# Altium project RPI_2354A_v0p0.PrjPcb
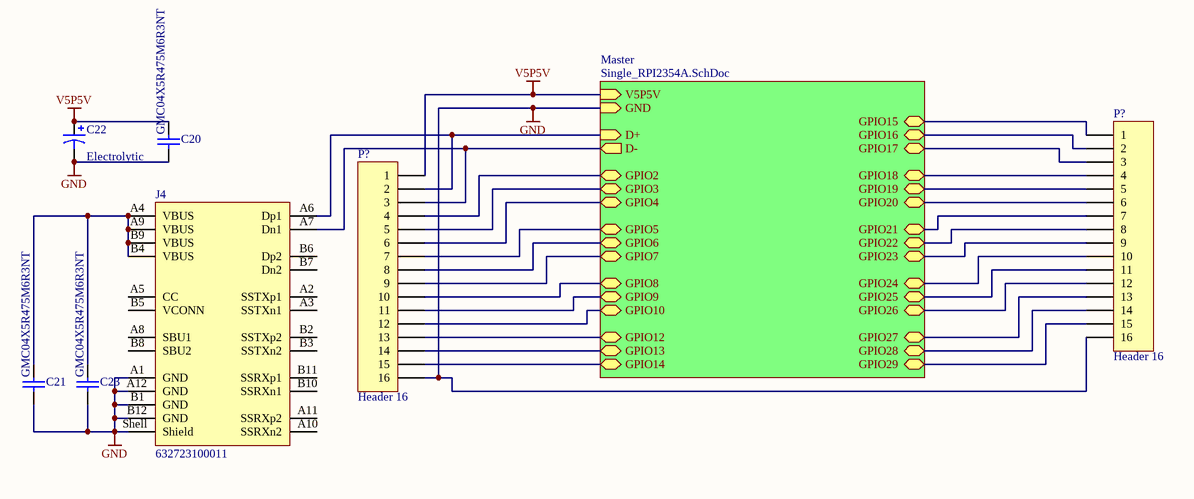
[diagram p0: HUB.SchDoc]
2 sheets, 43 parts. Net scope: hierarchical (ports join the sheet entries above them; power ports are global).
Board file: PCB1.PcbDoc
Sheets:
  HUB.SchDoc
    Master = Single_RPI2354A.SchDoc

## Sheet HUB.SchDoc
size A; SheetNumber: 1; SheetTotal: 2

### Parts
(Parts that share a designator on the sheet are numbered #1, #2 ... from top to bottom, then left to right.)
C20  GMC04X5R475M6R3NT  [0402]
C21  GMC04X5R475M6R3NT  [0402]
C22  Electrolytic  [Axial C - small]
C23  GMC04X5R475M6R3NT  [0402]
J4  632723100011  [632723100011]
P?#1  Header 16  [HDR2X8]
P?#2  Header 16  [HDR2X8]

### Sub-sheets
Master = Single_RPI2354A.SchDoc: V5P5V (in), GND (in), D+ (in), D- (out), GPIO2 (bidir), GPIO3 (bidir), GPIO4 (bidir), GPIO5 (bidir), GPIO6 (bidir), GPIO7 (bidir), GPIO8 (bidir), GPIO9 (bidir), GPIO10 (bidir), GPIO15 (bidir), GPIO16 (bidir), GPIO18 (bidir), GPIO19 (bidir), GPIO21 (bidir), GPIO22 (bidir), GPIO24 (bidir), GPIO25 (bidir), GPIO27 (bidir), GPIO28 (bidir), GPIO29 (bidir), GPIO12 (bidir), GPIO13 (bidir), GPIO14 (bidir), GPIO17 (bidir), GPIO20 (bidir), GPIO23 (bidir), GPIO26 (bidir)

### Nets
GND: C20.1 C21.1 C22.2 C23.1 J4.A1(GND) J4.A12(GND) J4.B1(GND) J4.B12(GND) J4.Shell(Shield) P?#1.16 P?#2.16 ; sheet Master/GND
V5P5V: C20.2 C22.1 P?#2.1 ; sheet Master/V5P5V
G2: P?#2.4 ; sheet Master/GPIO2
G3: P?#2.5 ; sheet Master/GPIO3
G4: P?#2.6 ; sheet Master/GPIO4
G5: P?#2.7 ; sheet Master/GPIO5
G6: P?#2.8 ; sheet Master/GPIO6
G7: P?#2.9 ; sheet Master/GPIO7
G8: P?#2.10 ; sheet Master/GPIO8
G9: P?#2.11 ; sheet Master/GPIO9
G10: P?#2.12 ; sheet Master/GPIO10
G12: P?#2.13 ; sheet Master/GPIO12
G13: P?#2.14 ; sheet Master/GPIO13
G14: P?#2.15 ; sheet Master/GPIO14
G15: P?#1.1 ; sheet Master/GPIO15
G16: P?#1.2 ; sheet Master/GPIO16
G17: P?#1.3 ; sheet Master/GPIO17
G18: P?#1.4 ; sheet Master/GPIO18
G19: P?#1.5 ; sheet Master/GPIO19
G20: P?#1.6 ; sheet Master/GPIO20
G21: P?#1.7 ; sheet Master/GPIO21
G22: P?#1.8 ; sheet Master/GPIO22
G23: P?#1.9 ; sheet Master/GPIO23
G24: P?#1.10 ; sheet Master/GPIO24
G25: P?#1.11 ; sheet Master/GPIO25
G26: P?#1.12 ; sheet Master/GPIO26
G27: P?#1.13 ; sheet Master/GPIO27
G28: P?#1.14 ; sheet Master/GPIO28
G29: P?#1.15 ; sheet Master/GPIO29
NetC21_2: C21.2 C23.2 J4.A4(VBUS) J4.A9(VBUS) J4.B4(VBUS) J4.B9(VBUS)
NetJ4_A6: J4.A6(Dp1) P?#2.2 ; sheet Master/D+
NetJ4_A7: J4.A7(Dn1) P?#2.3 ; sheet Master/D-

Not connected (* = marked no-connect by the designer): J4 A2(SSTXp1) A3(SSTXn1) A5(CC) A8(SBU1) A10(SSRXn2) A11(SSRXp2) B2(SSTXp2) B3(SSTXn2) B5(VCONN) B6(Dp2) B7(Dn2) B8(SBU2) B10(SSRXn1) B11(SSRXp1)

### Library data of the parts
C20 C21 C23 = Cap: Capacitor; Value: 100pF; Published: 8-Jun-2000; LatestRevisionDate: 17-Jul-2002; LatestRevisionNote: Re-released for DXP Platform.; PackageReference: RAD-0.3; Publisher: Altium Limited; PackageDescription: Radial Cap, Thru-Hole; 2 Leads; 0.3 in Pin Spacing
C22 = Cap Pol1: Polarized Capacitor (Radial); Value: 100pF; Published: 8-Jun-2000; LatestRevisionDate: 17-Jul-2002; LatestRevisionNote: Re-released for DXP Platform.; PackageReference: RB7.6-15; Publisher: Altium Limited; PackageDescription: Polarized Capacitor (Radial); 2 Leads
J4 = CMP-1502-03213-4: USB Connector, 24 Contact(s), Female, Right Angle, Solder and Surface Mount Terminal, Receptacle; Number of Contacts: 24; Voltage Rating: 20V; Contact Resistance: 30mΩ; Current Rating: 5A; USB Standard: USB 3.1; Insulation Resistance: 1GΩ; Pin Length: 1.5mm; Gender: Receptacle; Connector Type: USB; Min Operating Temperature: -40°C; Orientation: Horizontal; Mount: Surface Mount, Through Hole; Contact Material: Gold, Nickel; Packaging: Tape and Reel; Number of Pins: 24; Height: 3.16mm; RoHS: Compliant; Max Operating Temperature: 105°C
P?#1 P?#2 = Header 16: Header, 16-Pin; LatestRevisionDate: 17-Jul-2002; LatestRevisionNote: Re-released for DXP Platform.; Publisher: Altium Limited

## Sheet Single_RPI2354A.SchDoc
size A; SheetNumber: 2; SheetTotal: 2
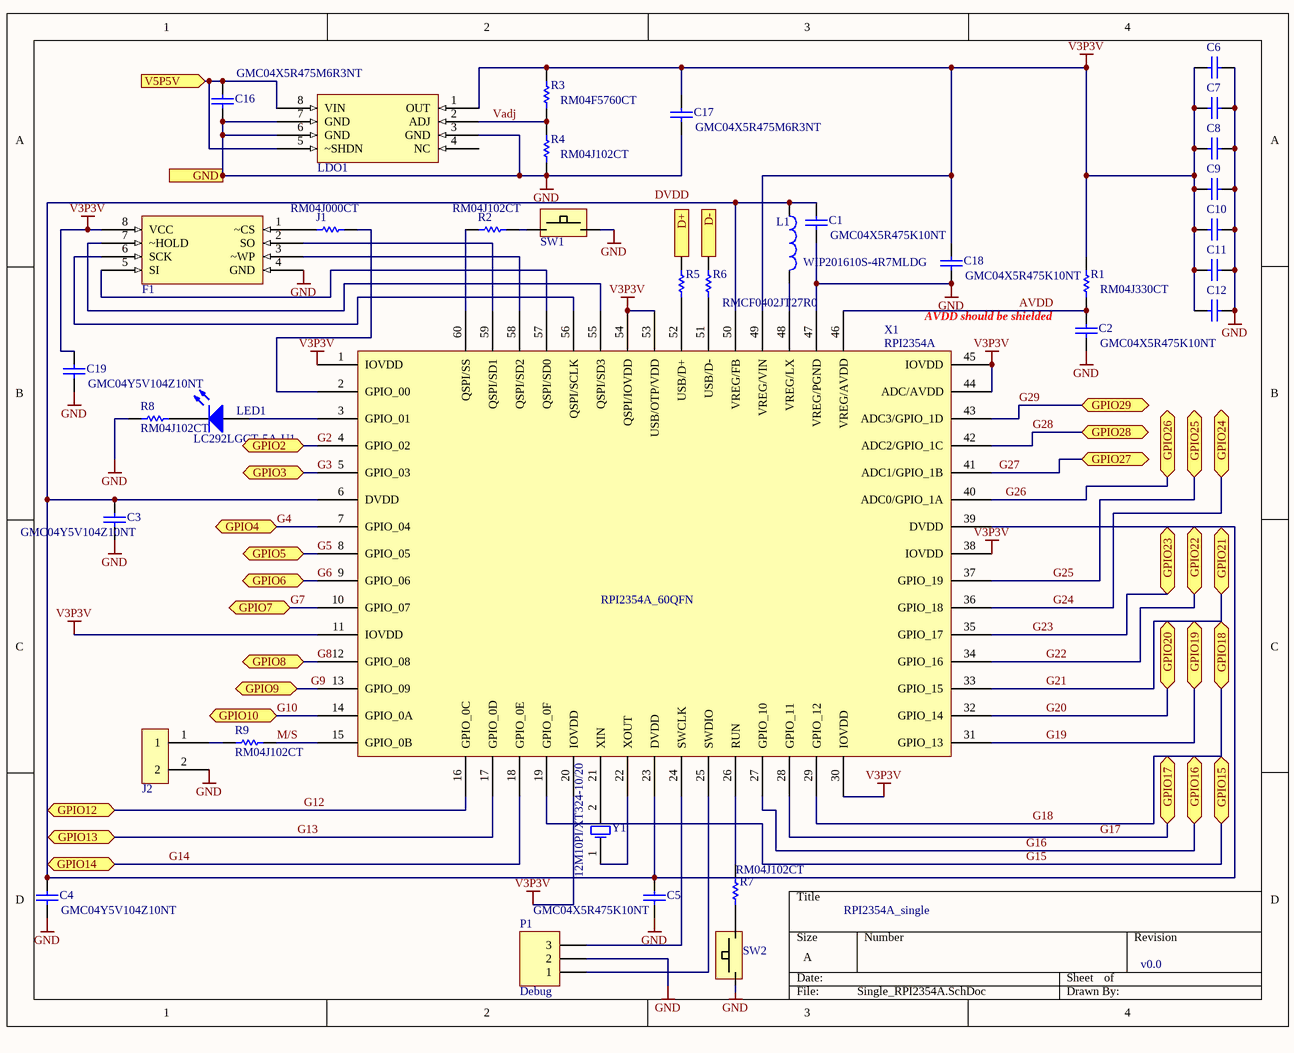
[diagram p1: Single_RPI2354A.SchDoc]

### Parts
C1  GMC04X5R475K10NT  [0402]
C2  GMC04X5R475K10NT  [0402]
C3  GMC04Y5V104Z10NT  [0402]
C4  GMC04Y5V104Z10NT  [0402]
C5  GMC04X5R475K10NT  [0402]
C6  GMC04Y5V104Z10NT  [0402]  (value not drawn)
C7  GMC04Y5V104Z10NT  [0402]  (value not drawn)
C8  GMC04Y5V104Z10NT  [0402]  (value not drawn)
C9  GMC04Y5V104Z10NT  [0402]  (value not drawn)
C10  GMC04Y5V104Z10NT  [0402]  (value not drawn)
C11  GMC04Y5V104Z10NT  [0402]  (value not drawn)
C12  GMC04Y5V104Z10NT  [0402]  (value not drawn)
C16  GMC04X5R475M6R3NT  [0402]
C17  GMC04X5R475M6R3NT  [0402]
C18  GMC04X5R475K10NT  [0402]
C19  GMC04Y5V104Z10NT  [0402]
F1  AT25SF128A-SHB-T  [SOIC127P800X216-8N]  (value not drawn)
J1  RM04J000CT  [0402]
J2  jumper_1x2  [HDR1X2]  (value not drawn)
L1  WIP201610S-4R7MLDG  [2016[0806]]
LDO1  ADPL42010A  [SOIC127P600X175-8N]  (value not drawn)
LED1  LC292LGCT-5A-U1  [0402]
P1  Debug  [HDR1X3]
R1  RM04J330CT  [0402]
R2  RM04J102CT  [0402]
R3  RM04F5760CT  [0402]
R4  RM04J102CT  [0402]
R5  RMCF0402JT27R0  [0402]
R6  RMCF0402JT27R0  [0402]  (value not drawn)
R7  RM04J102CT  [0402]
R8  RM04J102CT  [0402]
R9  RM04J102CT  [0402]
SW1  PushButton  [CT11024.3F260]  (value not drawn)
SW2  PushButton  [CT11024.3F260]  (value not drawn)
X1  RPI2354A  [QFN40P700X700X85_HS-61N]
Y1  12M10PI/XT324-10/20  [DFN320X250X70-4N]

### Ports
D+ (in, see HUB[3A]), D- (out, see HUB[3A]), GND (in, see HUB[3A]), GPIO2 (bidir, see HUB[3A]), GPIO3 (bidir, see HUB[3A]), GPIO4 (bidir, see HUB[3A]), GPIO5 (bidir, see HUB[3A]), GPIO6 (bidir, see HUB[3B]), GPIO7 (bidir, see HUB[3B]), GPIO8 (bidir, see HUB[3B]), GPIO9 (bidir, see HUB[3B]), GPIO10 (bidir, see HUB[3B]), GPIO12 (bidir, see HUB[3B]), GPIO13 (bidir, see HUB[3B]), GPIO14 (bidir, see HUB[3B]), GPIO15 (bidir, see HUB[4A]), GPIO16 (bidir, see HUB[4A]), GPIO17 (bidir, see HUB[4A]), GPIO18 (bidir, see HUB[4A]), GPIO19 (bidir, see HUB[4A]), GPIO20 (bidir, see HUB[4A]), GPIO21 (bidir, see HUB[4A]), GPIO22 (bidir, see HUB[4B]), GPIO23 (bidir, see HUB[4B]), GPIO24 (bidir, see HUB[4B]), GPIO25 (bidir, see HUB[4B]), GPIO26 (bidir, see HUB[4B]), GPIO27 (bidir, see HUB[4B]), GPIO28 (bidir, see HUB[4B]), GPIO29 (bidir, see HUB[4B]), V5P5V (in, see HUB[3A])

### Nets
GND: C1.1 C2.1 C3.1 C4.1 C5.1 C6.1 C7.1 C8.1 C9.1 C10.1 C11.1 C12.1 C16.1 C17.1 C18.1 C19.1 F1.4(GND) J2.2 LDO1.3(GND) LDO1.6(GND) LDO1.7(GND) P1.2 R4.1 R8.1 SW1.1(Gate) SW2.2(Source) X1.47(VREG/PGND) ; port GND
V3P3V: C6.2 C7.2 C8.2 C9.2 C10.2 C11.2 C12.2 C17.2 C18.2 C19.2 F1.8(VCC) LDO1.1(OUT) R1.2 R3.2 X1.1(IOVDD) X1.11(IOVDD) X1.20(IOVDD) X1.30(IOVDD) X1.38(IOVDD) X1.44(ADC/AVDD) X1.45(IOVDD) X1.49(VREG/VIN) X1.53(USB/OTP/VDD) X1.54(QSPI/IOVDD)
V5P5V: C16.2 LDO1.5(~SHDN) LDO1.8(VIN) ; port V5P5V
AVDD: C2.2 R1.1 X1.46(VREG/AVDD)
DVDD: C1.2 C3.2 C4.2 C5.2 L1.1 X1.6(DVDD) X1.23(DVDD) X1.39(DVDD) X1.50(VREG/FB)
G2: X1.4(GPIO_02) ; port GPIO2
G3: X1.5(GPIO_03) ; port GPIO3
G4: X1.7(GPIO_04) ; port GPIO4
G5: X1.8(GPIO_05) ; port GPIO5
G6: X1.9(GPIO_06) ; port GPIO6
G7: X1.10(GPIO_07) ; port GPIO7
G8: X1.12(GPIO_08) ; port GPIO8
G9: X1.13(GPIO_09) ; port GPIO9
G10: X1.14(GPIO_0A) ; port GPIO10
G12: X1.16(GPIO_0C) ; port GPIO12
G13: X1.17(GPIO_0D) ; port GPIO13
G14: X1.18(GPIO_0E) ; port GPIO14
G15: X1.19(GPIO_0F) ; port GPIO15
G16: X1.27(GPIO_10) ; port GPIO16
G17: X1.28(GPIO_11) ; port GPIO17
G18: X1.29(GPIO_12) ; port GPIO18
G19: X1.31(GPIO_13) ; port GPIO19
G20: X1.32(GPIO_14) ; port GPIO20
G21: X1.33(GPIO_15) ; port GPIO21
G22: X1.34(GPIO_16) ; port GPIO22
G23: X1.35(GPIO_17) ; port GPIO23
G24: X1.36(GPIO_18) ; port GPIO24
G25: X1.37(GPIO_19) ; port GPIO25
G26: X1.40(ADC0/GPIO_1A) ; port GPIO26
G27: X1.41(ADC1/GPIO_1B) ; port GPIO27
G28: X1.42(ADC2/GPIO_1C) ; port GPIO28
G29: X1.43(ADC3/GPIO_1D) ; port GPIO29
M/S: R9.2 X1.15(GPIO_0B)
Vadj: LDO1.2(ADJ) R3.1 R4.2
NetF1_1: F1.1(~CS) J1.2
NetF1_2: F1.2(SO) X1.59(QSPI/SD1)
NetF1_3: F1.3(~WP) X1.58(QSPI/SD2)
NetF1_5: F1.5(SI) X1.57(QSPI/SD0)
NetF1_6: F1.6(SCK) X1.56(QSPI/SCLK)
NetF1_7: F1.7(~HOLD) X1.55(QSPI/SD3)
NetJ1_1: J1.1 X1.2(GPIO_00)
NetJ2_1: J2.1 R9.1
NetJ4_A6: R5.1 ; port D+
NetJ4_A7: R6.1 ; port D-
NetL1_2: L1.2 X1.48(VREG/LX)
NetLED1_1: LED1.1(A) X1.3(GPIO_01)
NetLED1_2: LED1.2(K) R8.2
NetP1_1: P1.1 X1.25(SWDIO)
NetP1_3: P1.3 X1.24(SWCLK)
NetR2_1: R2.1 SW1.2(Source)
NetR2_2: R2.2 X1.60(QSPI/SS)
NetR5_2: R5.2 X1.52(USB/D+)
NetR6_2: R6.2 X1.51(USB/D-)
NetR7_1: R7.1 X1.26(RUN)
NetR7_2: R7.2 SW2.1(Gate)
NetX1_21: X1.21(XIN) Y1.2(OSC2)
NetX1_22: X1.22(XOUT) Y1.1(OSC1)

Not connected (* = marked no-connect by the designer): LDO1 4(NC)

### Notes on the sheet
- AVDD should be shielded
- RPI2354A_single
- v0.0
- (in symbol RPI2354A) RPI2354A_60QFN

### Library data of the parts
C1-C12 C16-C19 = Cap: Capacitor; Value: 100pF; Published: 8-Jun-2000; LatestRevisionDate: 17-Jul-2002; LatestRevisionNote: Re-released for DXP Platform.; PackageReference: RAD-0.3; Publisher: Altium Limited; PackageDescription: Radial Cap, Thru-Hole; 2 Leads; 0.3 in Pin Spacing
J1 R1-R9 = Res1: Resistor; Value: 1K; Published: 8-Jun-2000; LatestRevisionDate: 17-Jul-2002; LatestRevisionNote: Re-released for DXP Platform.; PackageReference: AXIAL-0.3; Publisher: Altium Limited; PackageDescription: Axial Device, Thru-Hole; 2 Leads; 0.3 in Pin Spacing
L1 = Inductor: Code_IEC: 1005; Value: 10mH; Published: 8-Jun-2000; LatestRevisionDate: 29-May-2009; LatestRevisionNote: IPC-7351 Footprint Added.; PackageReference: 0402-A; Publisher: Altium Limited; PackageDescription: Chip Inductor; Code_JEITA: 0402
LED1 = LED0: Typical INFRARED GaAs LED; Published: 8-Jun-2000; LatestRevisionDate: 08-Jul-2005; LatestRevisionNote: Mech Layer 1 removed.; PackageReference: LED-0; Publisher: Altium Limited; PackageDescription: LED; 2 Leads
P1 = Header 3: Header, 3-Pin; LatestRevisionDate: 17-Jul-2002; LatestRevisionNote: Re-released for DXP Platform.; Publisher: Altium Limited
SW1 SW2 = PushButton: GPTS203211B
Y1 = XTAL: Crystal Oscillator; Published: 8-Jun-2000; LatestRevisionDate: 17-Jul-2002; LatestRevisionNote: Re-released for DXP Platform.; PackageReference: R38; Publisher: Altium Limited; PackageDescription: Crystal, Thru-Hole; 2 Leads; Body 3.1 x 8.2 mm (Dia.xH)

## Nets that join several sheets
GND: HUB (11 pins), Single_RPI2354A (27 pins)
V5P5V: HUB (C20.2 C22.1 P?#2.1), Single_RPI2354A (C16.2 LDO1.5 LDO1.8)
G2: HUB (P?#2.4), Single_RPI2354A (X1.4)
G3: HUB (P?#2.5), Single_RPI2354A (X1.5)
G4: HUB (P?#2.6), Single_RPI2354A (X1.7)
G5: HUB (P?#2.7), Single_RPI2354A (X1.8)
G6: HUB (P?#2.8), Single_RPI2354A (X1.9)
G7: HUB (P?#2.9), Single_RPI2354A (X1.10)
G8: HUB (P?#2.10), Single_RPI2354A (X1.12)
G9: HUB (P?#2.11), Single_RPI2354A (X1.13)
G10: HUB (P?#2.12), Single_RPI2354A (X1.14)
G12: HUB (P?#2.13), Single_RPI2354A (X1.16)
G13: HUB (P?#2.14), Single_RPI2354A (X1.17)
G14: HUB (P?#2.15), Single_RPI2354A (X1.18)
G15: HUB (P?#1.1), Single_RPI2354A (X1.19)
G16: HUB (P?#1.2), Single_RPI2354A (X1.27)
G17: HUB (P?#1.3), Single_RPI2354A (X1.28)
G18: HUB (P?#1.4), Single_RPI2354A (X1.29)
G19: HUB (P?#1.5), Single_RPI2354A (X1.31)
G20: HUB (P?#1.6), Single_RPI2354A (X1.32)
G21: HUB (P?#1.7), Single_RPI2354A (X1.33)
G22: HUB (P?#1.8), Single_RPI2354A (X1.34)
G23: HUB (P?#1.9), Single_RPI2354A (X1.35)
G24: HUB (P?#1.10), Single_RPI2354A (X1.36)
G25: HUB (P?#1.11), Single_RPI2354A (X1.37)
G26: HUB (P?#1.12), Single_RPI2354A (X1.40)
G27: HUB (P?#1.13), Single_RPI2354A (X1.41)
G28: HUB (P?#1.14), Single_RPI2354A (X1.42)
G29: HUB (P?#1.15), Single_RPI2354A (X1.43)
NetJ4_A6: HUB (J4.A6 P?#2.2), Single_RPI2354A (R5.1)
NetJ4_A7: HUB (J4.A7 P?#2.3), Single_RPI2354A (R6.1)